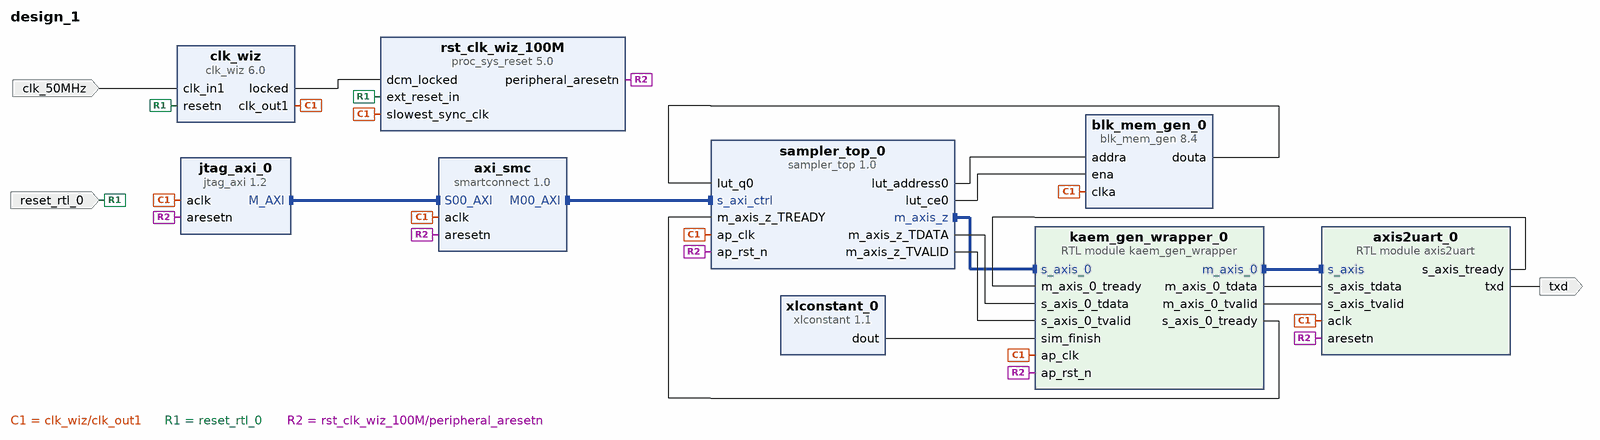
[diagram p0: block diagram of the top level]
# Vivado block design design_1, xc7k325tffg676-2, Vivado 2025.1
create_bd_design design_1

create_bd_port -dir I -type clk clk_50MHz
set_property -dict {CONFIG.CLK_DOMAIN design_1_clk_50MHz CONFIG.FREQ_HZ 50000000} [get_bd_ports clk_50MHz]
create_bd_port -dir I -type rst reset_rtl_0
set_property -dict {CONFIG.POLARITY ACTIVE_LOW} [get_bd_ports reset_rtl_0]
create_bd_port -dir O txd

create_bd_cell -type module -reference kaem_gen_wrapper kaem_gen_wrapper_0
create_bd_cell -type ip -vlnv xilinx.com:ip:blk_mem_gen:8.4 blk_mem_gen_0
set_property -dict [list \
  CONFIG.Coe_File ../../../../../build/lut_assets/lut.coe \
  CONFIG.Load_Init_File true \
  CONFIG.Write_Depth_A 209920 \
  CONFIG.Write_Width_A 8 \
  CONFIG.use_bram_block Stand_Alone \
] [get_bd_cells blk_mem_gen_0]
create_bd_cell -type ip -vlnv xilinx.com:ip:clk_wiz:6.0 clk_wiz
set_property -dict [list \
  CONFIG.CLKIN1_JITTER_PS 200.0 \
  CONFIG.CLKOUT1_JITTER 162.035 \
  CONFIG.CLKOUT1_PHASE_ERROR 164.985 \
  CONFIG.CLKOUT1_REQUESTED_OUT_FREQ 100.0 \
  CONFIG.MMCM_CLKFBOUT_MULT_F 20.000 \
  CONFIG.MMCM_CLKIN1_PERIOD 20.000 \
  CONFIG.MMCM_CLKIN2_PERIOD 10.0 \
  CONFIG.PRIM_IN_FREQ 50.000 \
  CONFIG.RESET_PORT resetn \
  CONFIG.RESET_TYPE ACTIVE_LOW \
] [get_bd_cells clk_wiz]
create_bd_cell -type ip -vlnv xilinx.com:ip:proc_sys_reset:5.0 rst_clk_wiz_100M
create_bd_cell -type ip -vlnv xilinx.com:ip:jtag_axi:1.2 jtag_axi_0
create_bd_cell -type ip -vlnv xilinx.com:ip:smartconnect:1.0 axi_smc
set_property -dict {CONFIG.NUM_MI 1 CONFIG.NUM_SI 1} [get_bd_cells axi_smc]
create_bd_cell -type module -reference axis2uart axis2uart_0
create_bd_cell -type ip -vlnv xilinx.com:hls:sampler_top:1.0 sampler_top_0
create_bd_cell -type ip -vlnv xilinx.com:ip:xlconstant:1.1 xlconstant_0
set_property -dict {CONFIG.CONST_VAL 0} [get_bd_cells xlconstant_0]

# ---- connections ----

connect_bd_intf_net [get_bd_intf_pins axi_smc/M00_AXI] [get_bd_intf_pins sampler_top_0/s_axi_ctrl]
connect_bd_intf_net [get_bd_intf_pins jtag_axi_0/M_AXI] [get_bd_intf_pins axi_smc/S00_AXI]
connect_bd_intf_net [get_bd_intf_pins kaem_gen_wrapper_0/m_axis_0] [get_bd_intf_pins axis2uart_0/s_axis]
connect_bd_intf_net [get_bd_intf_pins sampler_top_0/m_axis_z] [get_bd_intf_pins kaem_gen_wrapper_0/s_axis_0]
connect_bd_net [get_bd_pins axis2uart_0/s_axis_tready] [get_bd_pins kaem_gen_wrapper_0/m_axis_0_tready]
connect_bd_net [get_bd_pins axis2uart_0/txd] [get_bd_ports txd]
connect_bd_net [get_bd_pins blk_mem_gen_0/douta] [get_bd_pins sampler_top_0/lut_q0]
connect_bd_net -net clk_100MHz_1 [get_bd_ports clk_50MHz] [get_bd_pins clk_wiz/clk_in1]
connect_bd_net [get_bd_pins clk_wiz/clk_out1] \
  [get_bd_pins kaem_gen_wrapper_0/ap_clk] [get_bd_pins rst_clk_wiz_100M/slowest_sync_clk] [get_bd_pins blk_mem_gen_0/clka] \
  [get_bd_pins axi_smc/aclk] [get_bd_pins jtag_axi_0/aclk] [get_bd_pins sampler_top_0/ap_clk] [get_bd_pins axis2uart_0/aclk]
connect_bd_net [get_bd_pins clk_wiz/locked] [get_bd_pins rst_clk_wiz_100M/dcm_locked]
connect_bd_net [get_bd_pins kaem_gen_wrapper_0/m_axis_0_tdata] [get_bd_pins axis2uart_0/s_axis_tdata]
connect_bd_net [get_bd_pins kaem_gen_wrapper_0/m_axis_0_tvalid] [get_bd_pins axis2uart_0/s_axis_tvalid]
connect_bd_net [get_bd_pins kaem_gen_wrapper_0/s_axis_0_tready] [get_bd_pins sampler_top_0/m_axis_z_TREADY]
connect_bd_net -net reset_rtl_0_1 [get_bd_ports reset_rtl_0] [get_bd_pins rst_clk_wiz_100M/ext_reset_in] [get_bd_pins clk_wiz/resetn]
connect_bd_net [get_bd_pins rst_clk_wiz_100M/peripheral_aresetn] \
  [get_bd_pins kaem_gen_wrapper_0/ap_rst_n] [get_bd_pins jtag_axi_0/aresetn] [get_bd_pins axi_smc/aresetn] \
  [get_bd_pins sampler_top_0/ap_rst_n] [get_bd_pins axis2uart_0/aresetn]
connect_bd_net [get_bd_pins sampler_top_0/lut_address0] [get_bd_pins blk_mem_gen_0/addra]
connect_bd_net [get_bd_pins sampler_top_0/lut_ce0] [get_bd_pins blk_mem_gen_0/ena]
connect_bd_net [get_bd_pins sampler_top_0/m_axis_z_TDATA] [get_bd_pins kaem_gen_wrapper_0/s_axis_0_tdata]
connect_bd_net [get_bd_pins sampler_top_0/m_axis_z_TVALID] [get_bd_pins kaem_gen_wrapper_0/s_axis_0_tvalid]
connect_bd_net [get_bd_pins xlconstant_0/dout] [get_bd_pins kaem_gen_wrapper_0/sim_finish]

# ---- address map ----
assign_bd_address -offset 0x00000000 -range 64K -target_address_space [get_bd_addr_spaces jtag_axi_0/Data] [get_bd_addr_segs sampler_top_0/s_axi_ctrl/Reg]

validate_bd_design
save_bd_design
